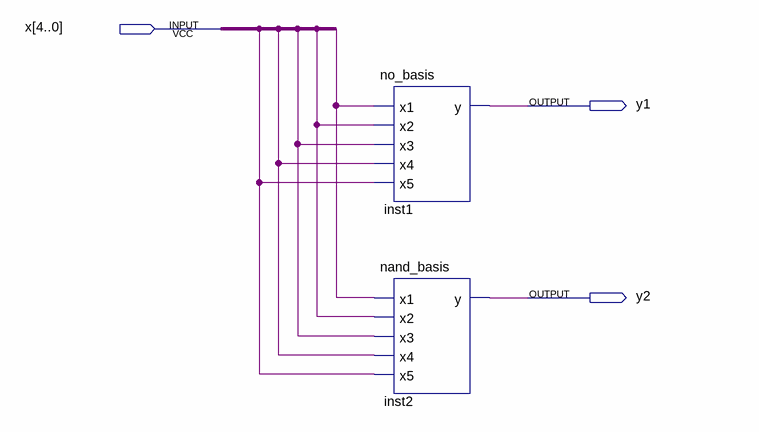
[diagram p0: schematic sheet]
// Quartus schematic lab1.bdf as structural Verilog: 2 symbols, 3 pins
module lab1 (
  input  [4:0] x,
  output y1,
  output y2
);

  no_basis inst1 (.x1(x[0]), .x2(x[1]), .x3(x[2]), .x4(x[3]), .x5(x[4]), .y(y1));
  nand_basis inst2 (.x1(x[0]), .x2(x[1]), .x3(x[2]), .x4(x[3]), .x5(x[4]), .y(y2));
endmodule
